# Altium schematic sheet Thunderbolt3.SCHdoc
size 812 x 584 mm; SheetNumber: 1; SheetTotal: 1
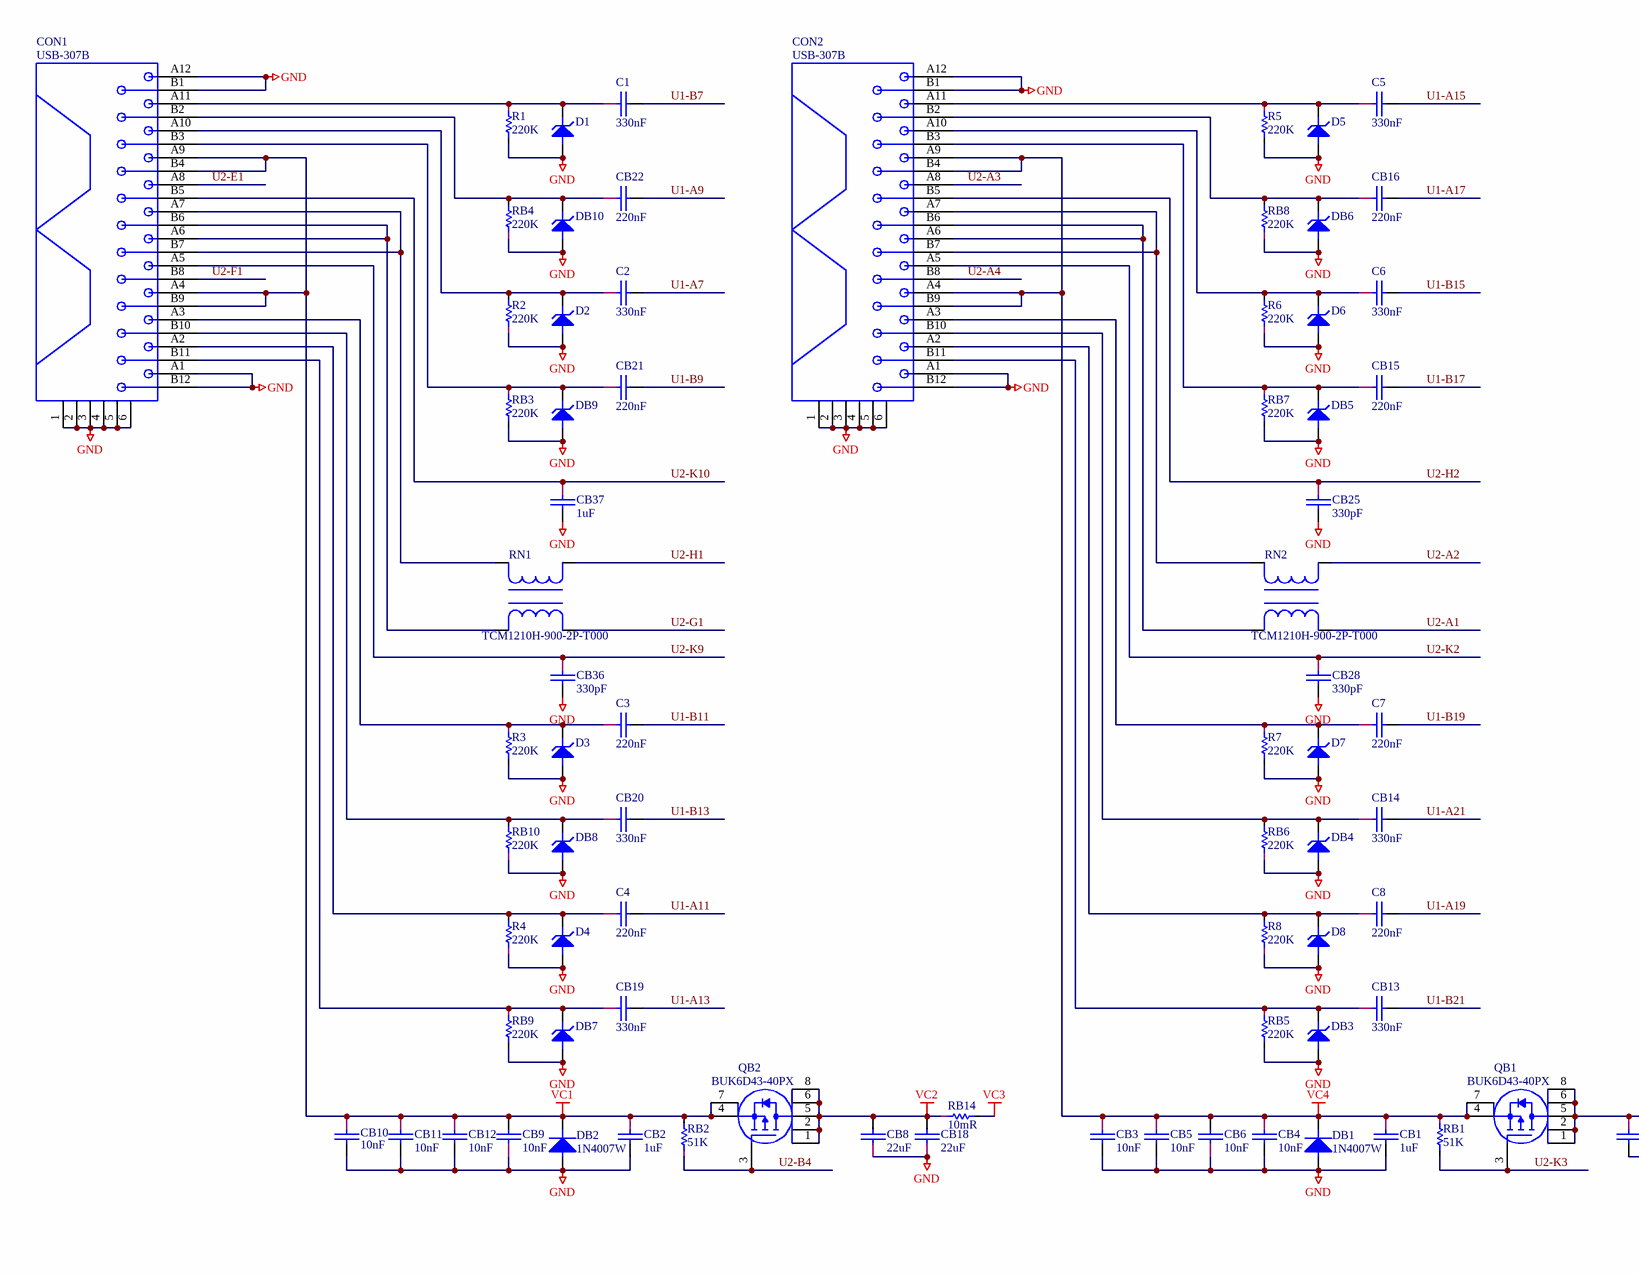
[diagram p0: Thunderbolt3.SCHdoc, top left]
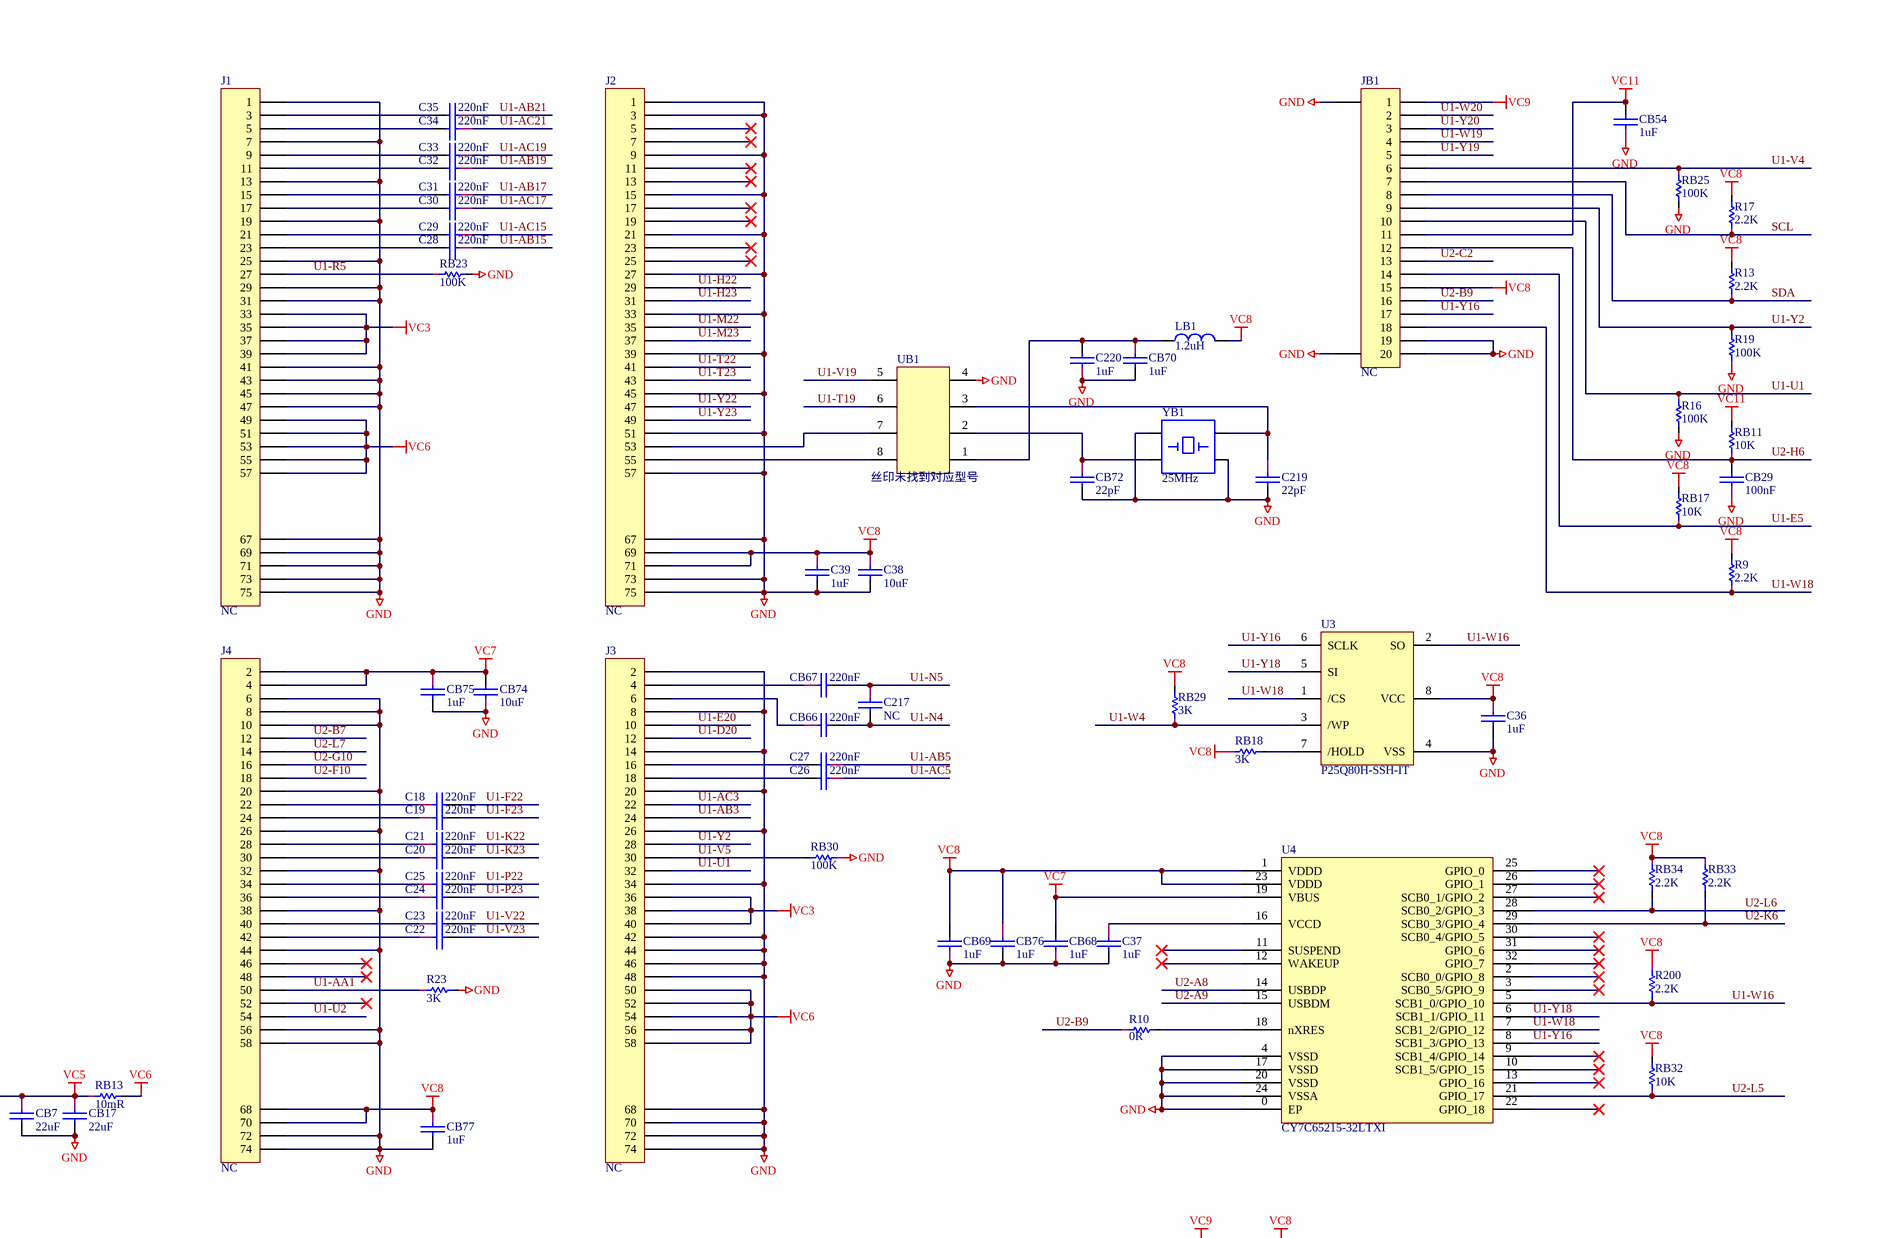
[diagram p1: Thunderbolt3.SCHdoc, top right]
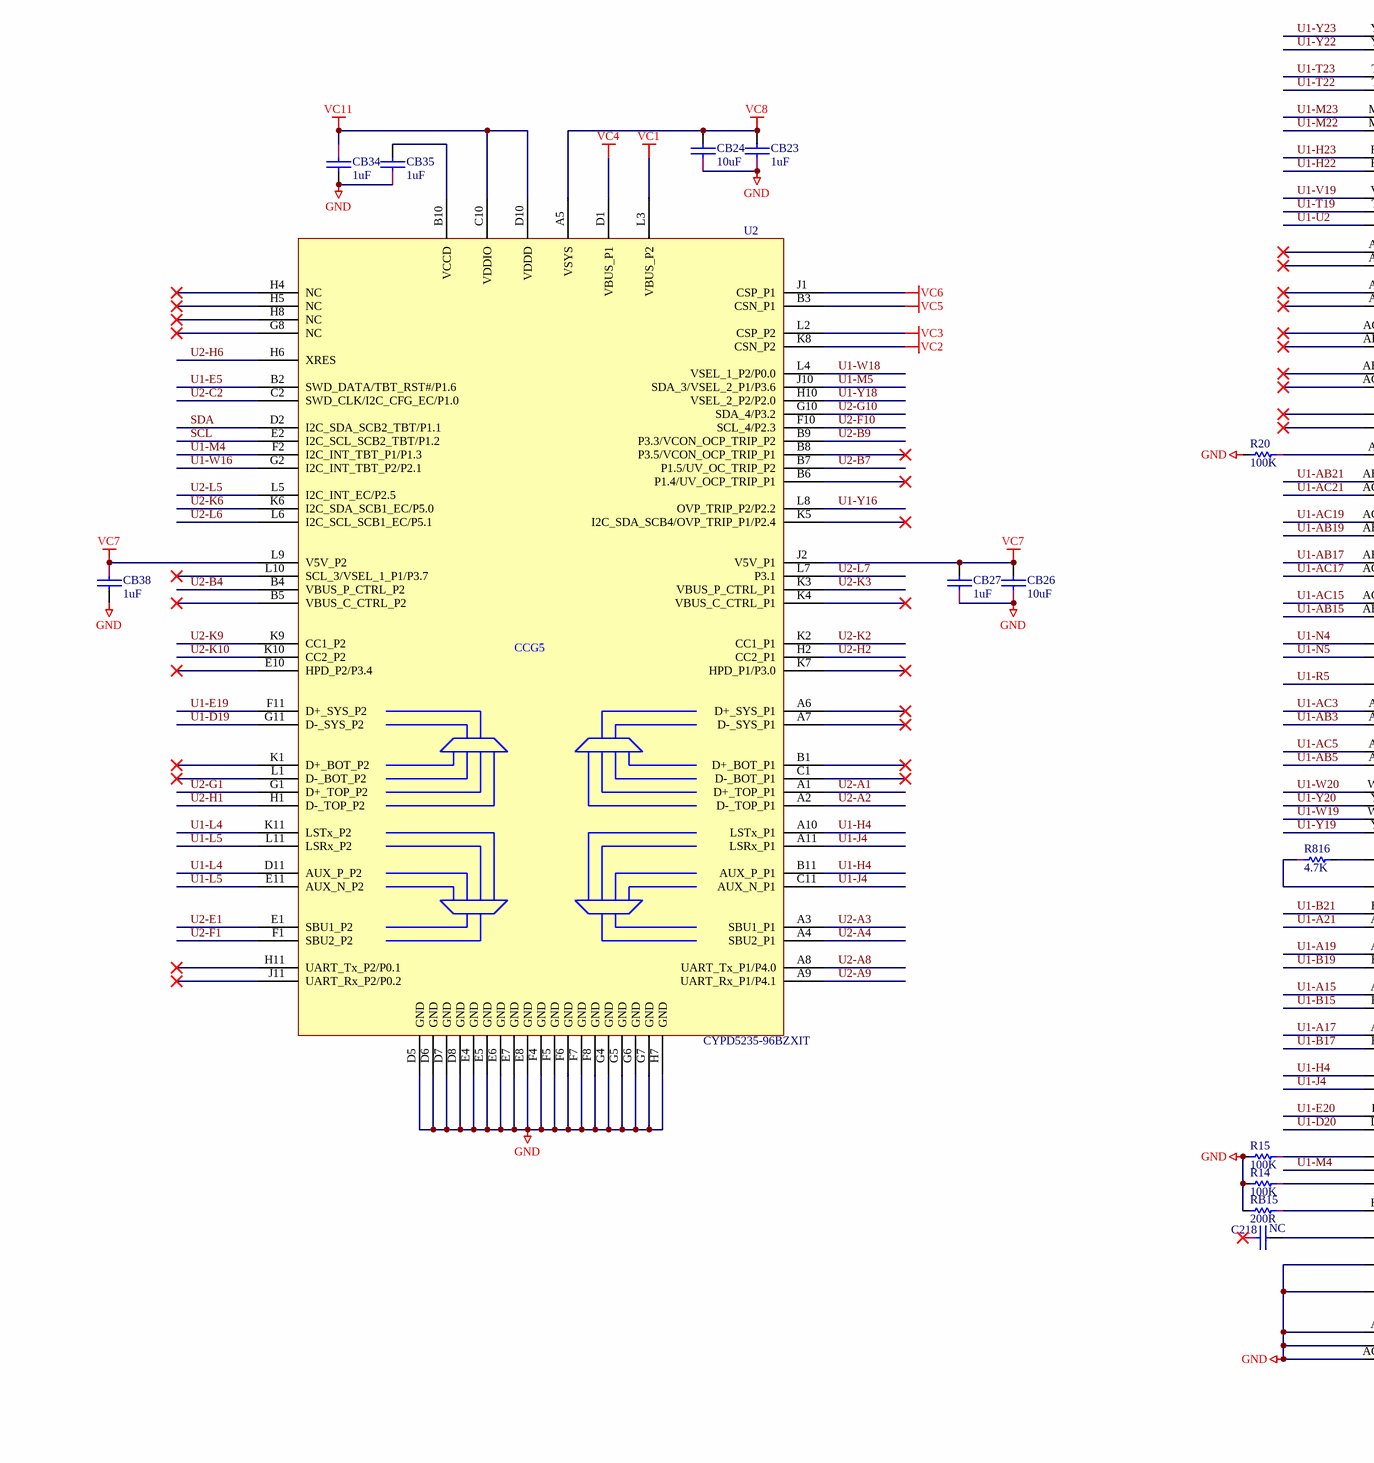
[diagram p2: Thunderbolt3.SCHdoc, bottom left]
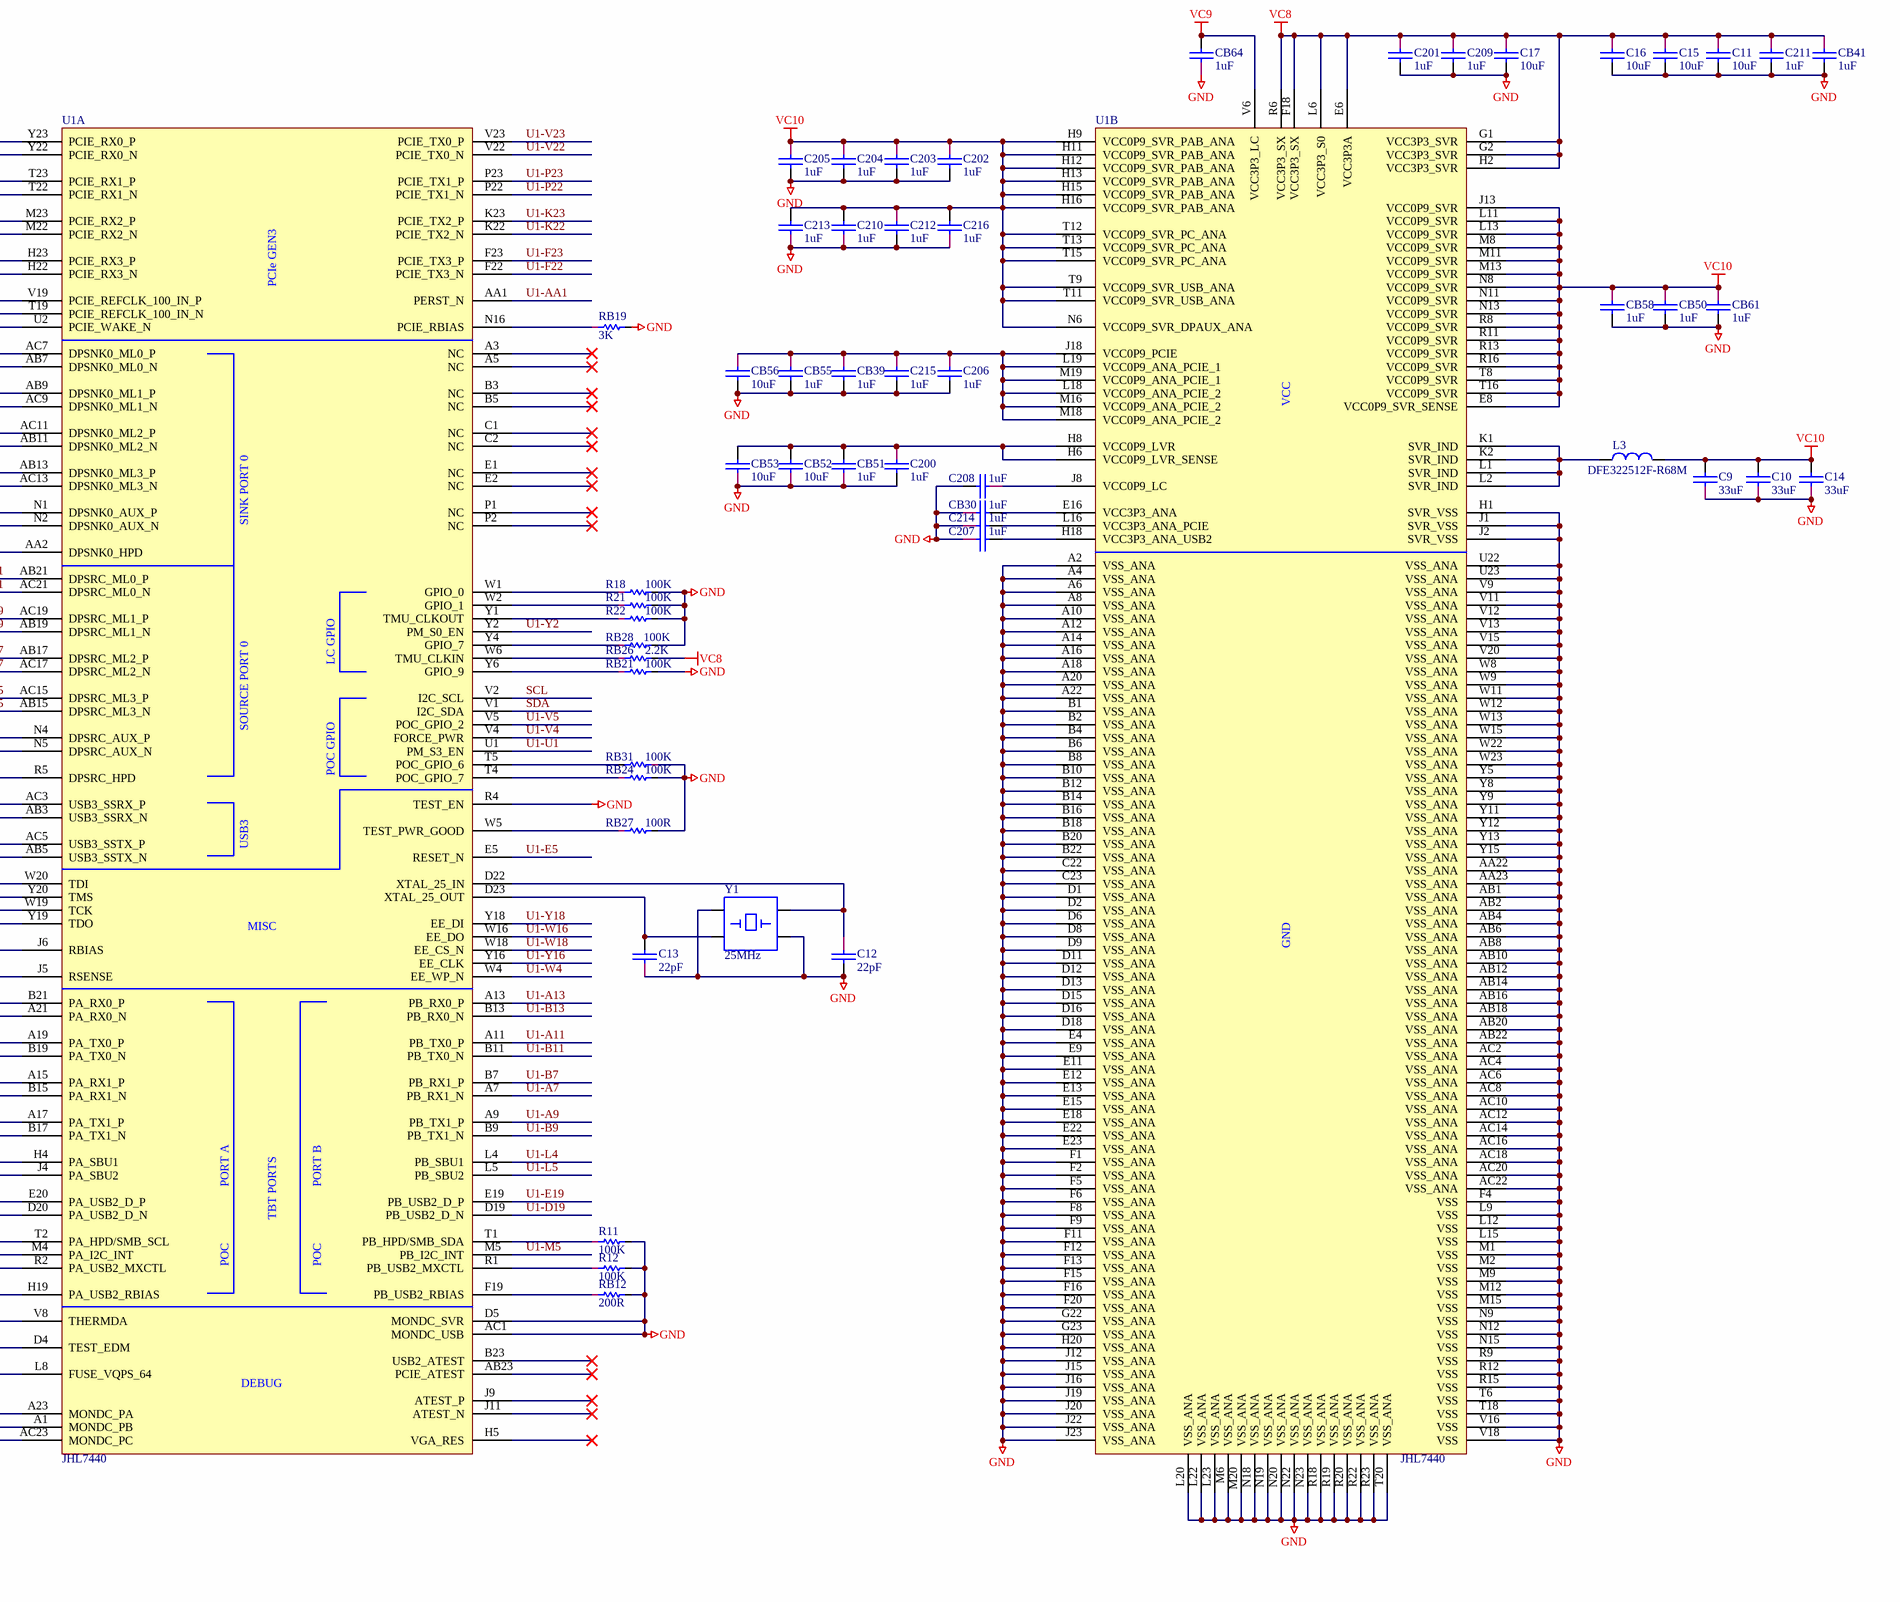
[diagram p3: Thunderbolt3.SCHdoc, bottom right]

## Parts
C1  330nF  [0201C]
C2  330nF  [0201C]
C3  220nF  [0201C]
C4  220nF  [0201C]
C5  330nF  [0201C]
C6  330nF  [0201C]
C7  220nF  [0201C]
C8  220nF  [0201C]
C9  33uF  [0603C]
C10  33uF  [0603C]
C11  10uF  [0402C]
C12  22pF  [0402C]
C13  22pF  [0402C]
C14  33uF  [0603C]
C15  10uF  [0402C]
C16  10uF  [0402C]
C17  10uF  [0402C]
C18  220nF  [0201C]
C19  220nF  [0201C]
C20  220nF  [0201C]
C21  220nF  [0201C]
C22  220nF  [0201C]
C23  220nF  [0201C]
C24  220nF  [0201C]
C25  220nF  [0201C]
C26  220nF  [0201C]
C27  220nF  [0201C]
C28  220nF  [0201C]
C29  220nF  [0201C]
C30  220nF  [0201C]
C31  220nF  [0201C]
C32  220nF  [0201C]
C33  220nF  [0201C]
C34  220nF  [0201C]
C35  220nF  [0201C]
C36  1uF  [0402C]
C37  1uF  [0402C]
C38  10uF  [0402C]
C39  1uF  [0402C]
C200  1uF  [0402C]
C201  1uF  [0402C]
C202  1uF  [0402C]
C203  1uF  [0402C]
C204  1uF  [0402C]
C205  1uF  [0402C]
C206  1uF  [0402C]
C207  1uF  [0402C]
C208  1uF  [0402C]
C209  1uF  [0402C]
C210  1uF  [0402C]
C211  1uF  [0402C]
C212  1uF  [0402C]
C213  1uF  [0402C]
C214  1uF  [0402C]
C215  1uF  [0402C]
C216  1uF  [0402C]
C217  NC  [0201C]
C218  NC  [0201C]
C219  22pF  [0402C]
C220  1uF  [0402C]
CB1  1uF  [0402C]
CB2  1uF  [0402C]
CB3  10nF  [0201C]
CB4  10nF  [0201C]
CB5  10nF  [0201C]
CB6  10nF  [0201C]
CB7  22uF  [0805C]
CB8  22uF  [0805C]
CB9  10nF  [0201C]
CB10  10nF  [0201C]
CB11  10nF  [0201C]
CB12  10nF  [0201C]
CB13  330nF  [0201C]
CB14  330nF  [0201C]
CB15  220nF  [0201C]
CB16  220nF  [0201C]
CB17  22uF  [0805C]
CB18  22uF  [0805C]
CB19  330nF  [0201C]
CB20  330nF  [0201C]
CB21  220nF  [0201C]
CB22  220nF  [0201C]
CB23  1uF  [0402C]
CB24  10uF  [0402C]
CB25  330pF  [0402C]
CB26  10uF  [0402C]
CB27  1uF  [0402C]
CB28  330pF  [0402C]
CB29  100nF  [0402C]
CB30  1uF  [0402C]
CB34  1uF  [0402C]
CB35  1uF  [0402C]
CB36  330pF  [0402C]
CB37  1uF  [0402C]
CB38  1uF  [0402C]
CB39  1uF  [0402C]
CB41  1uF  [0402C]
CB50  1uF  [0402C]
CB51  1uF  [0402C]
CB52  10uF  [0402C]
CB53  10uF  [0402C]
CB54  1uF  [0402C]
CB55  1uF  [0402C]
CB56  10uF  [0402C]
CB58  1uF  [0402C]
CB61  1uF  [0402C]
CB64  1uF  [0402C]
CB66  220nF  [0201C]
CB67  220nF  [0201C]
CB68  1uF  [0402C]
CB69  1uF  [0402C]
CB70  1uF  [0402C]
CB72  22pF  [0402C]
CB74  10uF  [0402C]
CB75  1uF  [0402C]
CB76  1uF  [0402C]
CB77  1uF  [0402C]
CON1  USB-307B  [SMD-CON]
CON2  USB-307B  [SMD-CON]
D1  (no value)  [SOD882]
D2  (no value)  [SOD882]
D3  (no value)  [SOD882]
D4  (no value)  [SOD882]
D5  (no value)  [SOD882]
D6  (no value)  [SOD882]
D7  (no value)  [SOD882]
D8  (no value)  [SOD882]
DB1  1N4007W  [SOD12]
DB2  1N4007W  [SOD12]
DB3  (no value)  [SOD882]
DB4  (no value)  [SOD882]
DB5  (no value)  [SOD882]
DB6  (no value)  [SOD882]
DB7  (no value)  [SOD882]
DB8  (no value)  [SOD882]
DB9  (no value)  [SOD882]
DB10  (no value)  [SOD882]
J1  NC  [SMDJ1]
J2  NC  [SMDJ1]
J3  NC  [SMDJ2]
J4  NC  [SMDJ2]
JB1  NC  [SMD]
L3  DFE322512F-R68M  [1210C]
LB1  1.2uH  [0402C]
QB1  BUK6D43-40PX  [DFN6]
QB2  BUK6D43-40PX  [DFN6]
R1  220K  [0201R]
R2  220K  [0201R]
R3  220K  [0201R]
R4  220K  [0201R]
R5  220K  [0201R]
R6  220K  [0201R]
R7  220K  [0201R]
R8  220K  [0201R]
R9  2.2K  [0402R]
R10  0R  [0402R]
R11  100K  [0402R]
R12  100K  [0402R]
R13  2.2K  [0402R]
R14  100K  [0402R]
R15  100K  [0402R]
R16  100K  [0402R]
R17  2.2K  [0402R]
R18  100K  [0402R]
R19  100K  [0402R]
R20  100K  [0402R]
R21  100K  [0402R]
R22  100K  [0402R]
R23  3K  [0402R]
R200  2.2K  [0402R]
R816  4.7K  [0402R]
RB1  51K  [0402R]
RB2  51K  [0402R]
RB3  220K  [0201R]
RB4  220K  [0201R]
RB5  220K  [0201R]
RB6  220K  [0201R]
RB7  220K  [0201R]
RB8  220K  [0201R]
RB9  220K  [0201R]
RB10  220K  [0201R]
RB11  10K  [0402R]
RB12  200R  [0402R]
RB13  10mR  [1206R]
RB14  10mR  [1206R]
RB15  200R  [0402R]
RB17  10K  [0402R]
RB18  3K  [0402R]
RB19  3K  [0402R]
RB21  100K  [0402R]
RB23  100K  [0402R]
RB24  100K  [0402R]
RB25  100K  [0402R]
RB26  2.2K  [0402R]
RB27  100R  [0402R]
RB28  100K  [0402R]
RB29  3K  [0402R]
RB30  100K  [0402R]
RB31  100K  [0402R]
RB32  10K  [0402R]
RB33  2.2K  [0402R]
RB34  2.2K  [0402R]
RN1  TCM1210H-900-2P-T000  [0402*2]
RN2  TCM1210H-900-2P-T000  [0402*2]
U1  JHL7440  [BGA2]  (parts A,B of 2)
U2  CYPD5235-96BZXIT  [BGA1]
U3  P25Q80H-SSH-IT  [SOP8]
U4  CY7C65215-32LTXI  [QFN32]
UB1  丝印未找到对应型号  [DFN8]
Y1  25MHz  [2016X]
YB1  25MHz  [2016X]

## Nets
GND: C9.2 C10.2 C11.1 C12.1 C13.2 C14.2 C15.1 C16.1 C17.1 C36.1 C37.1 C38.1 C39.1 C200.1 C201.1 C202.1 C203.1 C204.1 C205.1 C206.1 C207.2 C208.1 C209.1 C210.2 C211.1 C212.1 C213.2 C214.2 C215.1 C216.2 C219.1 C220.2 CB1.1 CB2.1 CB3.1 CB4.1 CB5.1 CB6.2 CB7.1 CB8.2 CB9.2 CB10.1 CB11.1 CB12.1 CB17.1 CB18.2 CB23.2 CB24.2 CB25.1 CB26.2 CB27.2 CB28.1 CB29.2 CB30.2 CB34.1 CB35.2 CB36.1 CB37.1 CB38.1 CB39.1 CB41.1 CB50.1 CB51.2 CB52.2 CB53.2 CB54.2 CB55.1 CB56.1 CB58.1 CB61.1 CB64.2 CB68.2 CB69.2 CB70.1 CB72.1 CB74.2 CB75.1 CB76.1 CB77.1 CON1.1 CON1.2 CON1.3 CON1.4 CON1.5 CON1.6 CON1.A1 CON1.A12 CON1.B1 CON1.B12 CON2.1 CON2.2 CON2.3 CON2.4 CON2.5 CON2.6 CON2.A1 CON2.A12 CON2.B1 CON2.B12 D1.2 D2.2 D3.2 D4.2 D5.2 D6.2 D7.2 D8.2 DB1.1(A) DB2.1(A) DB3.2 DB4.2 DB5.2 DB6.2 DB7.2 DB8.2 DB9.2 DB10.2 J1.1 J1.7 J1.13 J1.19 J1.25 J1.29 J1.31 J1.41 J1.43 J1.45 J1.47 J1.67 J1.69 J1.71 J1.73 J1.75 J2.1 J2.3 J2.9 J2.15 J2.21 J2.27 J2.33 J2.39 J2.45 J2.51 J2.57 J2.67 J2.73 J2.75 J3.2 J3.8 J3.14 J3.20 J3.26 J3.34 J3.42 J3.44 J3.46 J3.48 J3.68 J3.70 J3.72 J3.74 J4.6 J4.8 J4.10 J4.20 J4.26 J4.32 J4.38 J4.44 J4.56 J4.58 J4.72 J4.74 JB1.19 JB1.20 JB1.21 JB1.22 R1.1 R2.2 R3.1 R4.2 R5.1 R6.2 R7.1 R8.2 R11.1 R12.1 R14.1 R15.1 R16.1 R18.1 R19.2 R20.1 R21.1 R22.1 R23.1 RB3.1 RB4.2 RB5.1 RB6.2 RB7.1 RB8.2 RB9.1 RB10.2 RB12.1 RB15.1 RB19.1 RB21.1 RB23.1 RB24.1 RB25.1 RB27.1 RB28.1 RB30.2 RB31.2 U1.A1(MONDC_PB) U1.A2(VSS_ANA) U1.A4(VSS_ANA) U1.A6(VSS_ANA) U1.A8(VSS_ANA) U1.A10(VSS_ANA) U1.A12(VSS_ANA) U1.A14(VSS_ANA) U1.A16(VSS_ANA) U1.A18(VSS_ANA) U1.A20(VSS_ANA) U1.A22(VSS_ANA) U1.A23(MONDC_PA) U1.AA22(VSS_ANA) U1.AA23(VSS_ANA) U1.AB1(VSS_ANA) U1.AB2(VSS_ANA) U1.AB4(VSS_ANA) U1.AB6(VSS_ANA) U1.AB8(VSS_ANA) U1.AB10(VSS_ANA) U1.AB12(VSS_ANA) U1.AB14(VSS_ANA) U1.AB16(VSS_ANA) U1.AB18(VSS_ANA) U1.AB20(VSS_ANA) U1.AB22(VSS_ANA) U1.AC1(MONDC_USB) U1.AC2(VSS_ANA) U1.AC4(VSS_ANA) U1.AC6(VSS_ANA) U1.AC8(VSS_ANA) U1.AC10(VSS_ANA) U1.AC12(VSS_ANA) U1.AC14(VSS_ANA) U1.AC16(VSS_ANA) U1.AC18(VSS_ANA) U1.AC20(VSS_ANA) U1.AC22(VSS_ANA) U1.AC23(MONDC_PC) U1.B1(VSS_ANA) U1.B2(VSS_ANA) U1.B4(VSS_ANA) U1.B6(VSS_ANA) U1.B8(VSS_ANA) U1.B10(VSS_ANA) U1.B12(VSS_ANA) U1.B14(VSS_ANA) U1.B16(VSS_ANA) U1.B18(VSS_ANA) U1.B20(VSS_ANA) U1.B22(VSS_ANA) U1.C22(VSS_ANA) U1.C23(VSS_ANA) U1.D1(VSS_ANA) U1.D2(VSS_ANA) U1.D4(TEST_EDM) U1.D5(MONDC_SVR) U1.D6(VSS_ANA) U1.D8(VSS_ANA) U1.D9(VSS_ANA) U1.D11(VSS_ANA) U1.D12(VSS_ANA) U1.D13(VSS_ANA) U1.D15(VSS_ANA) U1.D16(VSS_ANA) U1.D18(VSS_ANA) U1.E4(VSS_ANA) U1.E9(VSS_ANA) U1.E11(VSS_ANA) U1.E12(VSS_ANA) U1.E13(VSS_ANA) U1.E15(VSS_ANA) U1.E18(VSS_ANA) U1.E22(VSS_ANA) U1.E23(VSS_ANA) U1.F1(VSS_ANA) U1.F2(VSS_ANA) U1.F4(VSS) U1.F5(VSS_ANA) U1.F6(VSS_ANA) U1.F8(VSS_ANA) U1.F9(VSS_ANA) U1.F11(VSS_ANA) U1.F12(VSS_ANA) U1.F13(VSS_ANA) U1.F15(VSS_ANA) U1.F16(VSS_ANA) U1.F20(VSS_ANA) U1.G22(VSS_ANA) U1.G23(VSS_ANA) U1.H1(SVR_VSS) U1.H20(VSS_ANA) U1.J1(SVR_VSS) U1.J2(SVR_VSS) U1.J12(VSS_ANA) U1.J15(VSS_ANA) U1.J16(VSS_ANA) U1.J19(VSS_ANA) U1.J20(VSS_ANA) U1.J22(VSS_ANA) U1.J23(VSS_ANA) U1.L8(FUSE_VQPS_64) U1.L9(VSS) U1.L12(VSS) U1.L15(VSS) U1.L20(VSS_ANA) U1.L22(VSS_ANA) U1.L23(VSS_ANA) U1.M1(VSS) U1.M2(VSS) U1.M6(VSS_ANA) U1.M9(VSS) U1.M12(VSS) U1.M15(VSS) U1.M20(VSS_ANA) U1.N9(VSS) U1.N12(VSS) U1.N15(VSS) U1.N18(VSS_ANA) U1.N19(VSS_ANA) U1.N20(VSS_ANA) U1.N22(VSS_ANA) U1.N23(VSS_ANA) U1.R4(TEST_EN) U1.R9(VSS) U1.R12(VSS) U1.R15(VSS) U1.R18(VSS_ANA) U1.R19(VSS_ANA) U1.R20(VSS_ANA) U1.R22(VSS_ANA) U1.R23(VSS_ANA) U1.T6(VSS) U1.T18(VSS) U1.T20(VSS_ANA) U1.U22(VSS_ANA) U1.U23(VSS_ANA) U1.V9(VSS_ANA) U1.V11(VSS_ANA) U1.V12(VSS_ANA) U1.V13(VSS_ANA) U1.V15(VSS_ANA) U1.V16(VSS) U1.V18(VSS) U1.V20(VSS_ANA) U1.W8(VSS_ANA) U1.W9(VSS_ANA) U1.W11(VSS_ANA) U1.W12(VSS_ANA) U1.W13(VSS_ANA) U1.W15(VSS_ANA) U1.W22(VSS_ANA) U1.W23(VSS_ANA) U1.Y5(VSS_ANA) U1.Y8(VSS_ANA) U1.Y9(VSS_ANA) U1.Y11(VSS_ANA) U1.Y12(VSS_ANA) U1.Y13(VSS_ANA) U1.Y15(VSS_ANA) U2.D5(GND) U2.D6(GND) U2.D7(GND) U2.D8(GND) U2.E4(GND) U2.E5(GND) U2.E6(GND) U2.E7(GND) U2.E8(GND) U2.F4(GND) U2.F5(GND) U2.F6(GND) U2.F7(GND) U2.F8(GND) U2.G4(GND) U2.G5(GND) U2.G6(GND) U2.G7(GND) U2.H7(GND) U3.4(VSS) U4.0(EP) U4.4(VSSD) U4.17(VSSD) U4.20(VSSD) U4.24(VSSA) UB1.4 Y1.2 Y1.4 YB1.2 YB1.4
VC1: CB2.2 CB9.1 CB10.2 CB11.2 CB12.2 CON1.A4 CON1.A9 CON1.B4 CON1.B9 DB2.2(K) QB2.4(S) QB2.7 RB2.1 U2.L3(VBUS_P2)
VC2: CB8.1 CB18.1 QB2.1 QB2.2 QB2.5(D) QB2.6 QB2.8 RB14.2 U2.K8(CSN_P2)
VC3: J1.33 J1.35 J1.37 J1.39 J3.36 J3.38 J3.40 RB14.1 U2.L2(CSP_P2)
VC4: CB1.2 CB3.2 CB4.2 CB5.2 CB6.1 CON2.A4 CON2.A9 CON2.B4 CON2.B9 DB1.2(K) QB1.4(S) QB1.7 RB1.2 U2.D1(VBUS_P1)
VC5: CB7.2 CB17.2 QB1.1 QB1.2 QB1.5(D) QB1.6 QB1.8 RB13.2 U2.B3(CSN_P1)
VC6: J1.49 J1.51 J1.53 J1.55 J1.57 J3.50 J3.52 J3.54 J3.56 J3.58 RB13.1 U2.J1(CSP_P1)
VC7: CB26.1 CB27.1 CB38.2 CB68.1 CB74.1 CB75.2 J4.2 J4.4 U2.J2(V5V_P1) U2.L9(V5V_P2) U4.19(VBUS)
VC8: C11.2 C15.2 C16.2 C17.2 C36.2 C38.2 C39.2 C201.2 C209.2 C211.2 CB23.1 CB24.1 CB41.2 CB69.1 CB76.2 CB77.2 J2.69 J2.71 J4.68 J4.70 JB1.15 LB1.1 R9.1 R13.1 R17.1 R200.2 RB17.1 RB18.2 RB26.1 RB29.1 RB32.1 RB33.2 RB34.2 U1.E6(VCC3P3A) U1.F18(VCC3P3_SX) U1.G1(VCC3P3_SVR) U1.G2(VCC3P3_SVR) U1.H2(VCC3P3_SVR) U1.L6(VCC3P3_S0) U1.R6(VCC3P3_SX) U2.A5(VSYS) U3.8(VCC) U4.1(VDDD) U4.23(VDDD)
VC9: CB64.1 JB1.1 U1.V6(VCC3P3_LC)
VC10: C9.1 C10.1 C14.1 C202.2 C203.2 C204.2 C205.2 C210.1 C212.2 C213.1 C216.1 CB50.2 CB58.2 CB61.2 L3.1 U1.E8(VCC0P9_SVR_SENSE) U1.H9(VCC0P9_SVR_PAB_ANA) U1.H11(VCC0P9_SVR_PAB_ANA) U1.H12(VCC0P9_SVR_PAB_ANA) U1.H13(VCC0P9_SVR_PAB_ANA) U1.H15(VCC0P9_SVR_PAB_ANA) U1.H16(VCC0P9_SVR_PAB_ANA) U1.J13(VCC0P9_SVR) U1.L11(VCC0P9_SVR) U1.L13(VCC0P9_SVR) U1.M8(VCC0P9_SVR) U1.M11(VCC0P9_SVR) U1.M13(VCC0P9_SVR) U1.N6(VCC0P9_SVR_DPAUX_ANA) U1.N8(VCC0P9_SVR) U1.N11(VCC0P9_SVR) U1.N13(VCC0P9_SVR) U1.R8(VCC0P9_SVR) U1.R11(VCC0P9_SVR) U1.R13(VCC0P9_SVR) U1.R16(VCC0P9_SVR) U1.T8(VCC0P9_SVR) U1.T9(VCC0P9_SVR_USB_ANA) U1.T11(VCC0P9_SVR_USB_ANA) U1.T12(VCC0P9_SVR_PC_ANA) U1.T13(VCC0P9_SVR_PC_ANA) U1.T15(VCC0P9_SVR_PC_ANA) U1.T16(VCC0P9_SVR)
VC11: CB34.2 CB54.1 JB1.11 RB11.1 U2.C10(VDDIO) U2.D10(VDDD)
SCL: JB1.7 R17.2 U1.V2(I2C_SCL) U2.E2(I2C_SCL_SCB2_TBT/P1.2)
SDA: JB1.8 R13.2 U1.V1(I2C_SDA) U2.D2(I2C_SDA_SCB2_TBT/P1.1)
U1-A7: C2.1 U1.A7(PB_RX1_N)
U1-A9: CB22.1 U1.A9(PB_TX1_P)
U1-A11: C4.1 U1.A11(PB_TX0_P)
U1-A13: CB19.1 U1.A13(PB_RX0_P)
U1-A15: C5.1 U1.A15(PA_RX1_P)
U1-A17: CB16.1 U1.A17(PA_TX1_P)
U1-A19: C8.1 U1.A19(PA_TX0_P)
U1-A21: CB14.1 U1.A21(PA_RX0_N)
U1-AA1: J4.50 R23.2 U1.AA1(PERST_N)
U1-AB3: J3.24 U1.AB3(USB3_SSRX_N)
U1-AB5: C27.2 U1.AB5(USB3_SSTX_N)
U1-AB15: C28.2 U1.AB15(DPSRC_ML3_N)
U1-AB17: C31.2 U1.AB17(DPSRC_ML2_P)
U1-AB19: C32.2 U1.AB19(DPSRC_ML1_N)
U1-AB21: C35.2 U1.AB21(DPSRC_ML0_P)
U1-AC3: J3.22 U1.AC3(USB3_SSRX_P)
U1-AC5: C26.2 U1.AC5(USB3_SSTX_P)
U1-AC15: C29.2 U1.AC15(DPSRC_ML3_P)
U1-AC17: C30.2 U1.AC17(DPSRC_ML2_N)
U1-AC19: C33.2 U1.AC19(DPSRC_ML1_P)
U1-AC21: C34.2 U1.AC21(DPSRC_ML0_N)
U1-B7: C1.1 U1.B7(PB_RX1_P)
U1-B9: CB21.1 U1.B9(PB_TX1_N)
U1-B11: C3.1 U1.B11(PB_TX0_N)
U1-B13: CB20.1 U1.B13(PB_RX0_N)
U1-B15: C6.1 U1.B15(PA_RX1_N)
U1-B17: CB15.1 U1.B17(PA_TX1_N)
U1-B19: C7.1 U1.B19(PA_TX0_N)
U1-B21: CB13.1 U1.B21(PA_RX0_P)
U1-D19: U1.D19(PB_USB2_D_N) U2.G11(D-_SYS_P2)
U1-D20: J3.12 U1.D20(PA_USB2_D_N)
U1-E5: JB1.14 RB17.2 U1.E5(RESET_N) U2.B2(SWD_DATA/TBT_RST#/P1.6)
U1-E19: U1.E19(PB_USB2_D_P) U2.F11(D+_SYS_P2)
U1-E20: J3.10 U1.E20(PA_USB2_D_P)
U1-F22: C18.1 U1.F22(PCIE_TX3_N)
U1-F23: C19.1 U1.F23(PCIE_TX3_P)
U1-H4: U1.H4(PA_SBU1) U2.A10(LSTx_P1) U2.B11(AUX_P_P1)
U1-H22: J2.29 U1.H22(PCIE_RX3_N)
U1-H23: J2.31 U1.H23(PCIE_RX3_P)
U1-J4: U1.J4(PA_SBU2) U2.A11(LSRx_P1) U2.C11(AUX_N_P1)
U1-K22: C21.1 U1.K22(PCIE_TX2_N)
U1-K23: C20.1 U1.K23(PCIE_TX2_P)
U1-L4: U1.L4(PB_SBU1) U2.D11(AUX_P_P2) U2.K11(LSTx_P2)
U1-L5: U1.L5(PB_SBU2) U2.E11(AUX_N_P2) U2.L11(LSRx_P2)
U1-M4: U1.M4(PA_I2C_INT) U2.F2(I2C_INT_TBT_P1/P1.3)
U1-M5: U1.M5(PB_I2C_INT) U2.J10(SDA_3/VSEL_2_P1/P3.6)
U1-M22: J2.35 U1.M22(PCIE_RX2_N)
U1-M23: J2.37 U1.M23(PCIE_RX2_P)
U1-N4: C217.1 CB66.1 U1.N4(DPSRC_AUX_P)
U1-N5: C217.2 CB67.1 U1.N5(DPSRC_AUX_N)
U1-P22: C25.1 U1.P22(PCIE_TX1_N)
U1-P23: C24.1 U1.P23(PCIE_TX1_P)
U1-R5: J1.27 RB23.2 U1.R5(DPSRC_HPD)
U1-T19: U1.T19(PCIE_REFCLK_100_IN_N) UB1.6
U1-T22: J2.41 U1.T22(PCIE_RX1_N)
U1-T23: J2.43 U1.T23(PCIE_RX1_P)
U1-U1: J3.32 JB1.10 R16.2 U1.U1(PM_S3_EN)
U1-U2: J4.54 U1.U2(PCIE_WAKE_N)
U1-V4: JB1.6 RB25.2 U1.V4(FORCE_PWR)
U1-V5: J3.30 RB30.1 U1.V5(POC_GPIO_2)
U1-V19: U1.V19(PCIE_REFCLK_100_IN_P) UB1.5
U1-V22: C23.1 U1.V22(PCIE_TX0_N)
U1-V23: C22.1 U1.V23(PCIE_TX0_P)
U1-W4: RB29.2 U1.W4(EE_WP_N) U3.3(/WP)
U1-W16: R200.1 U1.W16(EE_DO) U2.G2(I2C_INT_TBT_P2/P2.1) U3.2(SO) U4.5(SCB1_0/GPIO_10)
U1-W18: JB1.18 R9.2 U1.W18(EE_CS_N) U2.L4(VSEL_1_P2/P0.0) U3.1(/CS) U4.7(SCB1_2/GPIO_12)
U1-W19: JB1.4 U1.W19(TCK)
U1-W20: JB1.2 U1.W20(TDI)
U1-Y2: J3.28 JB1.9 R19.1 U1.Y2(PM_S0_EN)
U1-Y16: JB1.17 U1.Y16(EE_CLK) U2.L8(OVP_TRIP_P2/P2.2) U3.6(SCLK) U4.8(SCB1_3/GPIO_13)
U1-Y18: U1.Y18(EE_DI) U2.H10(VSEL_2_P2/P2.0) U3.5(SI) U4.6(SCB1_1/GPIO_11)
U1-Y19: JB1.5 U1.Y19(TDO)
U1-Y20: JB1.3 U1.Y20(TMS)
U1-Y22: J2.47 U1.Y22(PCIE_RX0_N)
U1-Y23: J2.49 U1.Y23(PCIE_RX0_P)
U2-A1: RN2.4 U2.A1(D+_TOP_P1)
U2-A2: RN2.3 U2.A2(D-_TOP_P1)
U2-A3: CON2.A8 U2.A3(SBU1_P1)
U2-A4: CON2.B8 U2.A4(SBU2_P1)
U2-A8: U2.A8(UART_Tx_P1/P4.0) U4.14(USBDP)
U2-A9: U2.A9(UART_Rx_P1/P4.1) U4.15(USBDM)
U2-B4: QB2.3(G) RB2.2 U2.B4(VBUS_P_CTRL_P2)
U2-B7: J4.12 U2.B7(P1.5/UV_OC_TRIP_P2)
U2-B9: JB1.16 R10.2 U2.B9(P3.3/VCON_OCP_TRIP_P2)
U2-C2: JB1.13 U2.C2(SWD_CLK/I2C_CFG_EC/P1.0)
U2-E1: CON1.A8 U2.E1(SBU1_P2)
U2-F1: CON1.B8 U2.F1(SBU2_P2)
U2-F10: J4.18 U2.F10(SCL_4/P2.3)
U2-G1: RN1.4 U2.G1(D+_TOP_P2)
U2-G10: J4.16 U2.G10(SDA_4/P3.2)
U2-H1: RN1.3 U2.H1(D-_TOP_P2)
U2-H2: CB25.2 CON2.B5 U2.H2(CC2_P1)
U2-H6: CB29.1 JB1.12 RB11.2 U2.H6(XRES)
U2-K2: CB28.2 CON2.A5 U2.K2(CC1_P1)
U2-K3: QB1.3(G) RB1.1 U2.K3(VBUS_P_CTRL_P1)
U2-K6: RB33.1 U2.K6(I2C_SDA_SCB1_EC/P5.0) U4.29(SCB0_3/GPIO_4)
U2-K9: CB36.2 CON1.A5 U2.K9(CC1_P2)
U2-K10: CB37.2 CON1.B5 U2.K10(CC2_P2)
U2-L5: RB32.2 U2.L5(I2C_INT_EC/P2.5) U4.21(GPIO_17)
U2-L6: RB34.1 U2.L6(I2C_SCL_SCB1_EC/P5.1) U4.28(SCB0_2/GPIO_3)
U2-L7: J4.14 U2.L7(P3.1)
NetC1_2: C1.2 CON1.A11 D1.1 R1.2
NetC2_2: C2.2 CON1.A10 D2.1 R2.1
NetC3_2: C3.2 CON1.A3 D3.1 R3.2
NetC4_2: C4.2 CON1.A2 D4.1 R4.1
NetC5_2: C5.2 CON2.A11 D5.1 R5.2
NetC6_2: C6.2 CON2.A10 D6.1 R6.1
NetC7_2: C7.2 CON2.A3 D7.1 R7.2
NetC8_2: C8.2 CON2.A2 D8.1 R8.1
NetC12_2: C12.2 U1.D22(XTAL_25_IN) Y1.1
NetC13_1: C13.1 U1.D23(XTAL_25_OUT) Y1.3
NetC18_2: C18.2 J4.22
NetC19_2: C19.2 J4.24
NetC20_2: C20.2 J4.30
NetC21_2: C21.2 J4.28
NetC22_2: C22.2 J4.42
NetC23_2: C23.2 J4.40
NetC24_2: C24.2 J4.36
NetC25_2: C25.2 J4.34
NetC26_1: C26.1 J3.18
NetC27_1: C27.1 J3.16
NetC28_1: C28.1 J1.23
NetC29_1: C29.1 J1.21
NetC30_1: C30.1 J1.17
NetC31_1: C31.1 J1.15
NetC32_1: C32.1 J1.11
NetC33_1: C33.1 J1.9
NetC34_1: C34.1 J1.5
NetC35_1: C35.1 J1.3
NetC37_2: C37.2 U4.16(VCCD)
NetC200_2: C200.2 CB51.1 CB52.1 CB53.1 U1.H6(VCC0P9_LVR_SENSE) U1.H8(VCC0P9_LVR)
NetC206_2: C206.2 C215.2 CB39.2 CB55.2 CB56.2 U1.J18(VCC0P9_PCIE) U1.L18(VCC0P9_ANA_PCIE_2) U1.L19(VCC0P9_ANA_PCIE_1) U1.M16(VCC0P9_ANA_PCIE_2) U1.M18(VCC0P9_ANA_PCIE_2) U1.M19(VCC0P9_ANA_PCIE_1)
NetC207_1: C207.1 U1.H18(VCC3P3_ANA_USB2)
NetC208_2: C208.2 U1.J8(VCC0P9_LC)
NetC214_1: C214.1 U1.L16(VCC3P3_ANA_PCIE)
NetC218_1: C218.1 U1.V8(THERMDA)
NetC219_2: C219.2 UB1.3 YB1.1
NetC220_1: C220.1 CB70.2 LB1.2 UB1.1
NetCB13_2: CB13.2 CON2.B11 DB3.1 RB5.2
NetCB14_2: CB14.2 CON2.B10 DB4.1 RB6.1
NetCB15_2: CB15.2 CON2.B3 DB5.1 RB7.2
NetCB16_2: CB16.2 CON2.B2 DB6.1 RB8.1
NetCB19_2: CB19.2 CON1.B11 DB7.1 RB9.2
NetCB20_2: CB20.2 CON1.B10 DB8.1 RB10.1
NetCB21_2: CB21.2 CON1.B3 DB9.1 RB3.2
NetCB22_2: CB22.2 CON1.B2 DB10.1 RB4.1
NetCB30_1: CB30.1 U1.E16(VCC3P3_ANA)
NetCB35_1: CB35.1 U2.B10(VCCD)
NetCB66_2: CB66.2 J3.6
NetCB67_2: CB67.2 J3.4
NetCB72_2: CB72.2 UB1.2 YB1.3
NetCON1_A6: CON1.A6 CON1.B6 RN1.1
NetCON1_A7: CON1.A7 CON1.B7 RN1.2
NetCON2_A6: CON2.A6 CON2.B6 RN2.1
NetCON2_A7: CON2.A7 CON2.B7 RN2.2
NetJ2_53: J2.53 UB1.7
NetJ2_55: J2.55 UB1.8
NetL3_2: L3.2 U1.K1(SVR_IND) U1.K2(SVR_IND) U1.L1(SVR_IND) U1.L2(SVR_IND)
NetR10_1: R10.1 U4.18(nXRES)
NetR11_2: R11.2 U1.T1(PB_HPD/SMB_SDA)
NetR12_2: R12.2 U1.R1(PB_USB2_MXCTL)
NetR14_2: R14.2 U1.R2(PA_USB2_MXCTL)
NetR15_2: R15.2 U1.T2(PA_HPD/SMB_SCL)
NetR18_2: R18.2 U1.W1(GPIO_0)
NetR20_2: R20.2 U1.AA2(DPSNK0_HPD)
NetR21_2: R21.2 U1.W2(GPIO_1)
NetR22_2: R22.2 U1.Y1(TMU_CLKOUT)
NetR816_1: R816.1 U1.J6(RBIAS)
NetR816_2: R816.2 U1.J5(RSENSE)
NetRB12_2: RB12.2 U1.F19(PB_USB2_RBIAS)
NetRB15_2: RB15.2 U1.H19(PA_USB2_RBIAS)
NetRB18_1: RB18.1 U3.7(/HOLD)
NetRB19_2: RB19.2 U1.N16(PCIE_RBIAS)
NetRB21_2: RB21.2 U1.Y6(GPIO_9)
NetRB24_2: RB24.2 U1.T4(POC_GPIO_7)
NetRB26_2: RB26.2 U1.W6(TMU_CLKIN)
NetRB27_2: RB27.2 U1.W5(TEST_PWR_GOOD)
NetRB28_2: RB28.2 U1.Y4(GPIO_7)
NetRB31_1: RB31.1 U1.T5(POC_GPIO_6)

Not connected (* = marked no-connect by the designer): C218 2*; J2 5* 7* 11* 13* 17* 19* 23* 25*; J4 46* 48* 52*; U1 A3(NC)* A5(NC)* AB7(DPSNK0_ML0_N)* AB9(DPSNK0_ML1_P)* AB11(DPSNK0_ML2_N)* AB13(DPSNK0_ML3_P)* AB23(PCIE_ATEST)* AC7(DPSNK0_ML0_P)* AC9(DPSNK0_ML1_N)* AC11(DPSNK0_ML2_P)* AC13(DPSNK0_ML3_N)* B3(NC)* B5(NC)* B23(USB2_ATEST)* C1(NC)* C2(NC)* E1(NC)* E2(NC)* H5(VGA_RES)* J9(ATEST_P)* J11(ATEST_N)* N1(DPSNK0_AUX_P)* N2(DPSNK0_AUX_N)* P1(NC)* P2(NC)*; U2 A6(D+_SYS_P1)* A7(D-_SYS_P1)* B1(D+_BOT_P1)* B5(VBUS_C_CTRL_P2)* B6(P1.4/UV_OCP_TRIP_P1)* B8(P3.5/VCON_OCP_TRIP_P1)* C1(D-_BOT_P1)* E10(HPD_P2/P3.4)* G8(NC)* H4(NC)* H5(NC)* H8(NC)* H11(UART_Tx_P2/P0.1)* J11(UART_Rx_P2/P0.2)* K1(D+_BOT_P2)* K4(VBUS_C_CTRL_P1)* K5(I2C_SDA_SCB4/OVP_TRIP_P1/P2.4)* K7(HPD_P1/P3.0)* L1(D-_BOT_P2)* L10(SCL_3/VSEL_1_P1/P3.7)*; U4 2(SCB0_0/GPIO_8)* 3(SCB0_5/GPIO_9)* 9(SCB1_4/GPIO_14)* 10(SCB1_5/GPIO_15)* 11(SUSPEND)* 12(WAKEUP)* 13(GPIO_16)* 22(GPIO_18)* 25(GPIO_0)* 26(GPIO_1)* 27(SCB0_1/GPIO_2)* 30(SCB0_4/GPIO_5)* 31(GPIO_6)* 32(GPIO_7)*

## Notes on the sheet
- (in symbol CYPD5235-96BZXIT) CCG5
- (in symbol JHL7440, part A) PCIe GEN3; SINK PORT 0; LC GPIO; SOURCE PORT 0; POC GPIO; USB3; MISC; PORT A; PORT B; TBT PORTS; POC; DEBUG
- (in symbol JHL7440, part B) VCC; GND

## Library data of the parts
C1-C39 C200-C220 CB1-CB30 CB34-CB39 CB41 CB50-CB56 CB58 CB61 CB64 CB66-CB70 CB72 CB74-CB77 = CAP: Capacitor
CON1 CON2 = USB24+6P/CW/A12-B12*
D1-D8 DB3-DB10 = DIODE-T: TVS Diode; Published: 8-Jun-2000; LatestRevisionDate: 17-Jul-2002; LatestRevisionNote: Re-released for DXP Platform.; PackageReference: DIODE-0.7; Publisher: Altium Limited; PackageDescription: Diode, Thru-Hole; 2 Leads; 0.7 in Pin Spacing
DB1 DB2 = DI: Diode
J1 J2 = CON80_1
J3 J4 = CON80_2
JB1 = CON20: Connector
L3 LB1 = DG
QB1 QB2 = N8P*_1
R1-R23 R200 R816 RB1-RB15 RB17-RB19 RB21 RB23-RB34 = RAS
RN1 RN2 = GEXQ/1-4_2-3
U3 = BY25Q32BSSIG*
U4 = CY7C65215-32LTXIT
UB1 = 8
Y1 YB1 = CRY4P